# Altium schematic sheet Serializer.SchDoc
size 420 x 297 mm; SheetNumber: 1; SheetTotal: 1
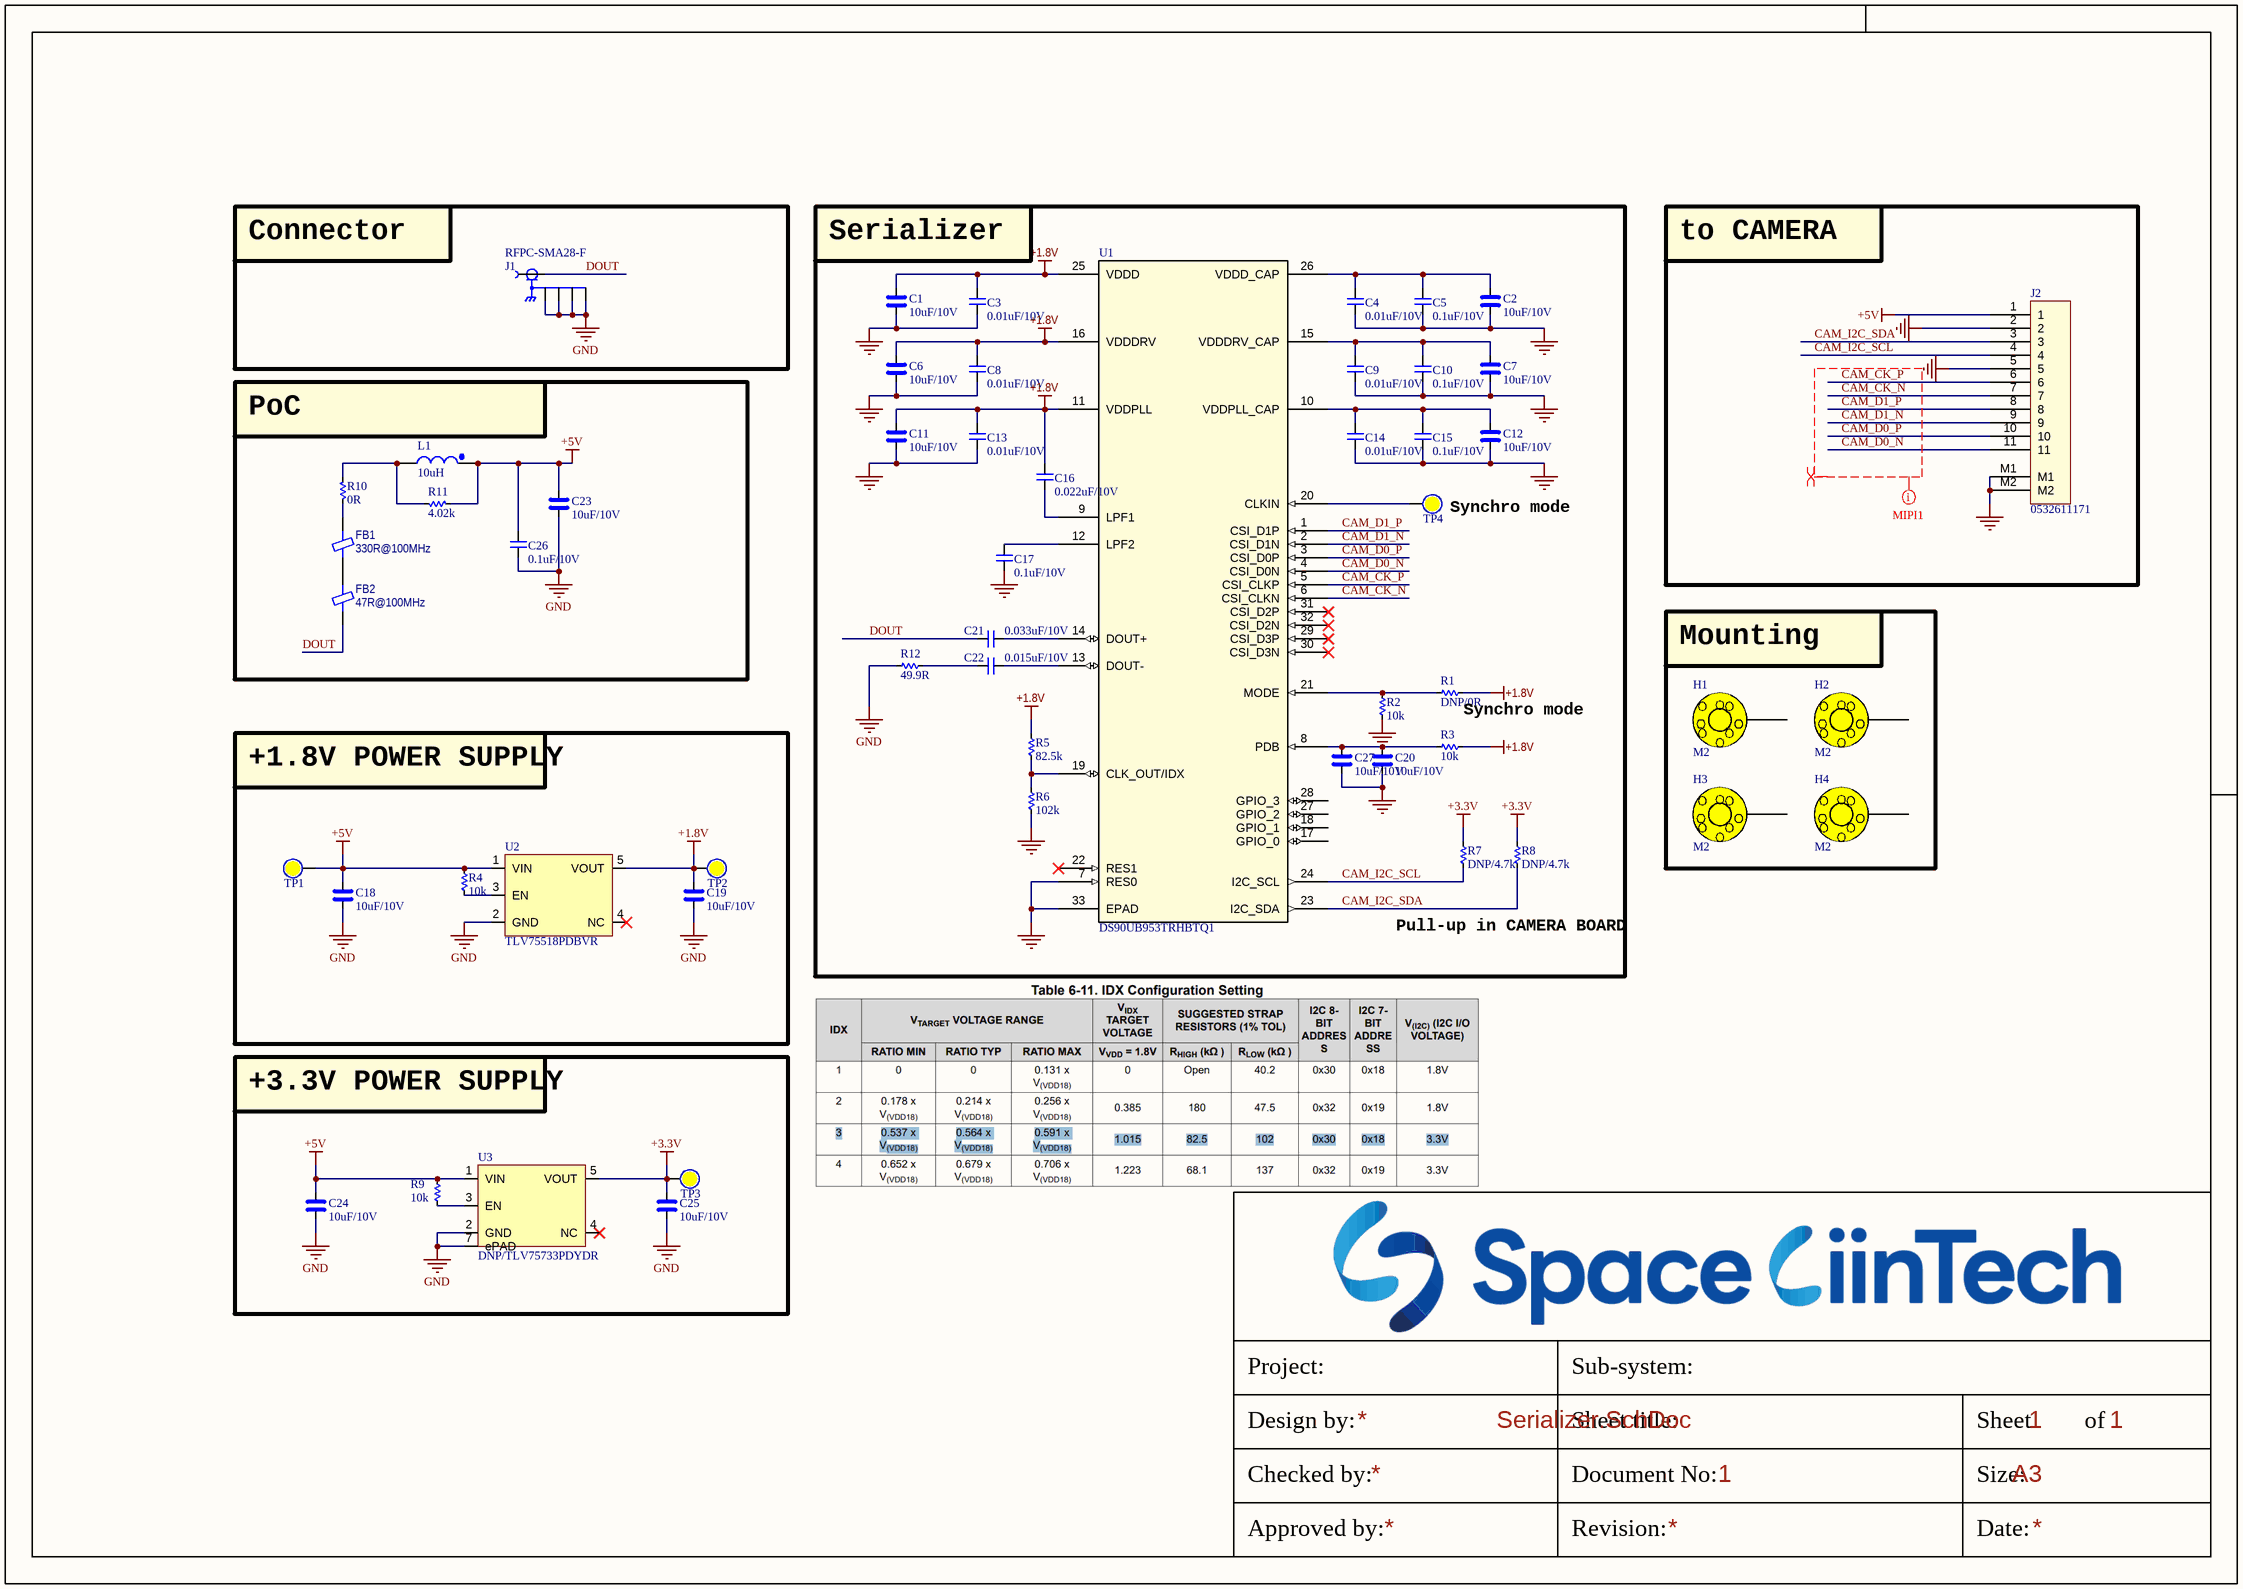
[diagram p0: Serializer.SchDoc]

## Parts
C1  10uF/10V  [CAP_C_1608X80]
C2  10uF/10V  [CAP_C_1608X80]
C3  0.01uF/10V  [CAP_C_1608X80]
C4  0.01uF/10V  [CAP_C_1608X80]
C5  0.1uF/10V  [CAP_C_1608X80]
C6  10uF/10V  [CAP_C_1608X80]
C7  10uF/10V  [CAP_C_1608X80]
C8  0.01uF/10V  [CAP_C_1608X80]
C9  0.01uF/10V  [CAP_C_1608X80]
C10  0.1uF/10V  [CAP_C_1608X80]
C11  10uF/10V  [CAP_C_1608X80]
C12  10uF/10V  [CAP_C_1608X80]
C13  0.01uF/10V  [CAP_C_1608X80]
C14  0.01uF/10V  [CAP_C_1608X80]
C15  0.1uF/10V  [CAP_C_1608X80]
C16  0.022uF/10V  [CAP_C_1608X80]
C17  0.1uF/10V  [CAP_C_1608X80]
C18  10uF/10V  [CAP_C_1608X80]
C19  10uF/10V  [CAP_C_1608X80]
C20  10uF/10V  [CAP_C_1608X80]
C21  0.033uF/10V  [CAP_C_1608X80]
C22  0.015uF/10V  [CAP_C_1608X80]
C23  10uF/10V  [CAP_C_1608X80]
C24  10uF/10V  [CAP_C_1608X80]
C25  10uF/10V  [CAP_C_1608X80]
C26  0.1uF/10V  [CAP_C_1608X80]
C27  10uF/10V  [CAP_C_1608X80]
FB1  330R@100MHz  [IND_C_1608X60]
FB2  47R@100MHz  [IND_C_1608X60]
H1  M2  [HEX-2.2mm]
H2  M2  [HEX-2.2mm]
H3  M2  [HEX-2.2mm]
H4  M2  [HEX-2.2mm]
J1  RFPC-SMA28-F  [GRADCONN_RFPC-SMA28-F]
J2  0532611171  [MOLEX_0532611171]
L1  10uH  [IND300X300X150]
R1  DNP/0R  [RES_C_1608X60]
R2  10k  [RES_C_1608X60]
R3  10k  [RES_C_1608X60]
R4  10k  [RES_C_1608X60]
R5  82.5k  [RES_C_1608X60]
R6  102k  [RES_C_1608X60]
R7  DNP/4.7k  [RES_C_1608X60]
R8  DNP/4.7k  [RES_C_1608X60]
R9  10k  [RES_C_1608X60]
R10  0R  [RES_C_1608X60]
R11  4.02k  [RES_C_1608X60]
R12  49.9R  [RES_C_1608X60]
TP1  (no value)  [Testpoint_50]  (no BOM)
TP2  (no value)  [Testpoint_50]  (no BOM)
TP3  (no value)  [Testpoint_50]  (no BOM)
TP4  (no value)  [Testpoint_TH_D130H80]  (no BOM)
U1  DS90UB953TRHBTQ1  [QFN-32_5X5_EP3.7X3.7]
U2  TLV75518PDBVR  [SOT25]
U3  DNP/TLV75733PDYDR  [SOT25-EPAD]

## Blocks framed on the sheet
Connector: J1
Serializer: C1-C17 C20-C22 C27 R1-R3 R5-R8 R12 TP4 U1
to CAMERA: J2
PoC: C23 C26 FB1 FB2 L1 R10 R11
Mounting: H1-H4
+1.8V POWER SUPPLY: C18 C19 R4 TP1 TP2 U2
+3.3V POWER SUPPLY: C24 C25 R9 TP3 U3

## Nets
+1.8V: C1.2 C3.2 C6.2 C8.2 C11.2 C13.2 C16.2 C19.2 R1.1 R3.1 R5.2 TP2.1 U1.11(VDDPLL) U1.16(VDDDRV) U1.25(VDDD) U2.5(VOUT)
+3.3V: C25.2 R7.1 R8.1 TP3.1 U3.5(VOUT)
+5V: C18.2 C23.2 C24.2 C26.2 J2.1 L1.1 R4.1 R9.2 R11.2 TP1.1 U2.1(VIN) U3.1(VIN)
GND: C1.1 C2.1 C3.1 C4.1 C5.1 C6.1 C7.1 C8.1 C9.1 C10.1 C11.1 C12.1 C13.1 C14.1 C15.1 C17.1 C18.1 C19.1 C20.1 C23.1 C24.1 C25.1 C26.1 C27.1 J1.G1 J1.G2 J1.G3 J1.G4 J2.2 J2.5 J2.M1 J2.M2 R2.2 R6.1 R12.2 U1.7(RES0) U1.33(EPAD) U2.2(GND) U3.2(GND) U3.7(ePAD)
CAM_CK_N: J2.7 U1.6(CSI_CLKN)
CAM_CK_P: J2.6 U1.5(CSI_CLKP)
CAM_D0_N: J2.11 U1.4(CSI_D0N)
CAM_D0_P: J2.10 U1.3(CSI_D0P)
CAM_D1_N: J2.9 U1.2(CSI_D1N)
CAM_D1_P: J2.8 U1.1(CSI_D1P)
CAM_I2C_SCL: J2.4 R7.2 U1.24(I2C_SCL)
CAM_I2C_SDA: J2.3 R8.2 U1.23(I2C_SDA)
DOUT: C21.2 FB2.1 J1.1
NetC2_2: C2.2 C4.2 C5.2 U1.26(VDDD_CAP)
NetC7_2: C7.2 C9.2 C10.2 U1.15(VDDDRV_CAP)
NetC12_2: C12.2 C14.2 C15.2 U1.10(VDDPLL_CAP)
NetC16_1: C16.1 U1.9(LPF1)
NetC17_2: C17.2 U1.12(LPF2)
NetC20_2: C20.2 C27.2 R3.2 U1.8(PDB)
NetC21_1: C21.1 U1.14(DOUT+)
NetC22_1: C22.1 U1.13(DOUT-)
NetC22_2: C22.2 R12.1
NetFB1_1: FB1.1 FB2.2
NetFB1_2: FB1.2 R10.2
NetL1_2: L1.2 R10.1 R11.1
NetR1_2: R1.2 R2.1 U1.21(MODE)
NetR4_2: R4.2 U2.3(EN)
NetR5_1: R5.1 R6.2 U1.19(CLK_OUT/IDX)
NetR9_1: R9.1 U3.3(EN)
NetTP4_1: TP4.1 U1.20(CLKIN)

Not connected (* = marked no-connect by the designer): H1 1; H2 1; H3 1; H4 1; U1 17(GPIO_0) 18(GPIO_1) 22(RES1)* 27(GPIO_2) 28(GPIO_3) 29(CSI_D3P)* 30(CSI_D3N)* 31(CSI_D2P)* 32(CSI_D2N)*; U2 4(NC)*; U3 4(NC)*

## Layout directives
net class MIPI1: CAM_CK_N, CAM_CK_P, CAM_D0_N, CAM_D0_P, CAM_D1_N, CAM_D1_P
differential pair; net class DIFF100; differential pair class DIFF100: CAM_CK_N, CAM_CK_P, CAM_D0_N, CAM_D0_P, CAM_D1_N, CAM_D1_P

## Notes on the sheet
- (near TP4) Synchro mode
- (near R1) Synchro mode
- Pull-up in CAMERA BOARD
- Project:
- Sub-system:
- Design by:
- Sheet title:
- Sheet
- of
- Checked by:
- Approved by:
- Revision:
- Document No:
- Size:
- Date:
- A3

## Library data of the parts
C1 C2 C6 C7 C11 C12 C18-C20 C23-C25 C27 = _CAP_C_High_2: CAP High Value
C3-C5 C8-C10 C13-C17 C21 C22 C26 = _CAP_C_2: CAP
FB1 FB2 = BLM18AG601SN1D: FERRITE BEAD 600 OHM 0603 1LN; Manufacturer: Murata Electronics; Current Rating (Max): 500mA; DC Resistance (DCR) (Max): 380mOhm; Impedance @ Frequency: 600 Ohms @ 100 MHz; Number of Lines: 1; Value: 600 Ohms @ 100 MHz; Part Number: BLM18AG601SN1D; ComponentLink1Description: Datasheet; ComponentLink1URL: https://www.murata.com/en-us/products/productdata/8796738650142/ENFA0003.pdf; ComponentLink2Description: DigiKey Link; ComponentLink2URL: https://www.digikey.com/en/products/detail/murata-electronics/BLM18AG601SN1D/584225; Device Package: 0603 (1608 Metric); Height (Max): 0.037" (0.95mm); LastUpdated: 7/10/2022 9:43:27 AM; Lifecycle Status: Active; Minimum Order: 1; Mounting Type: Surface Mount; Operating Temperature: -55°C ~ 125°C; Package / Case: 0603 (1608 Metric); Packaging: TapeAndReel; PartId: 848; Part Status: Active; Price: 0.02; Series: EMIFIL®, BLM18; Size / Dimension: 0.063" L x 0.032" W (1.60mm x 0.80mm); Supplier 1: DigiKey; Supplier Part Number 1: 490-1014-1-ND
H1-H4 = HEX-M3
J1 = RFPC-SMA28-F: SMA Connector Jack, Female Socket 50 Ohms Panel Mount, Through Hole Solder; MF: GradConn; SnapEDA_Link: https://www.snapeda.com/parts/RFPC-SMA28-F/GradConn/view-part/?ref=snap; Package: None; Value: *; MP: RFPC-SMA28-F; Check_prices: https://www.snapeda.com/parts/RFPC-SMA28-F/GradConn/view-part/?ref=eda
J2 = Header 11x1_2M
L1 = _IND
R1-R8 R10-R12 = _RES_B_2: RES
R9 = RES-SMD: RES-Chip; Manufacturer: Generic Components; Class: Passive; Published: 08/06/2000; Publisher: Altium Hobart Technology Centre
TP1-TP4 = Test Point: Solder: NF
U1 = IC_Serializer_DS90UB953TRHBTQ1: 2 MP MIPIÂ® CSI-2 FPD-Link III serializer for 2MP/60fps cameras & radar 32-VQFN -40 to 105; Manufacturer_Name: Texas Instruments; Copyright: Copyright (C) 2026 Ultra Librarian. All rights reserved.; Manufacturer_Part_Number: DS90UB953TRHBTQ1; Datasheet: https://www.ti.com/lit/gpn/ds90ub953-q1; RefDes: RefDes; Type: Type
U2 = IC_POWER_AP7347DQ
U3 = IC_POWER_TLV75733PDYDR